# Altium project slyfoc_v2.PrjPcb
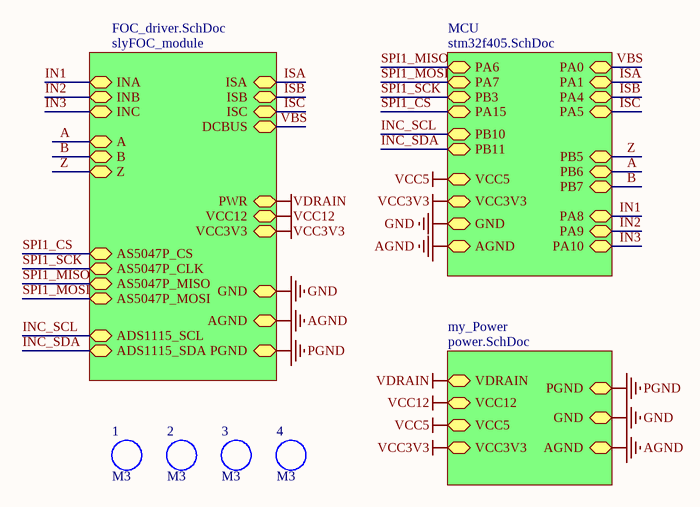
[diagram p0: control.SchDoc]
5 sheets, 141 parts. Net scope: hierarchical (ports join the sheet entries above them; power ports are global).
Board file: PCB.PcbDoc
Sheets:
  control.SchDoc
    my_Power = power.SchDoc
    MCU = stm32f405.SchDoc
    slyFOC_module = FOC_driver.SchDoc
      MOS_Half_Bridge_A = single_bridge.SchDoc
      MOS_Half_Bridge_B = single_bridge.SchDoc
      MOS_Half_Bridge_C = single_bridge.SchDoc

## Sheet control.SchDoc
size A4; SheetNumber: 1; SheetTotal: 5

### Parts
1  M3  [M3x9+6_N]
2  M3  [M3x9+6_N]
3  M3  [M3x9+6_N]
4  M3  [M3x9+6_N]

### Sub-sheets
MCU = stm32f405.SchDoc: PA1 (bidir), PA4 (bidir), PA5 (bidir), PA8 (bidir), PA9 (bidir), PA10 (bidir), PA0 (bidir), VCC3V3 (bidir), GND (bidir), AGND (bidir), PB5 (bidir), PB6 (bidir), PB7 (bidir), VCC5 (bidir), PA6 (bidir), PA7 (bidir), PB3 (bidir), PA15 (bidir), PB10 (bidir), PB11 (bidir)
my_Power = power.SchDoc: VCC12 (bidir), VDRAIN (bidir), VCC5 (bidir), VCC3V3 (bidir), GND (bidir), PGND (bidir), AGND (bidir)
slyFOC_module = FOC_driver.SchDoc: INA (bidir), INB (bidir), INC (bidir), ISA (bidir), ISB (bidir), ISC (bidir), PGND (bidir), AGND (bidir), GND (bidir), PWR (bidir), VCC12 (bidir), VCC3V3 (bidir), DCBUS (bidir), A (bidir), B (bidir), Z (bidir), AS5047P_CS (bidir), AS5047P_CLK (bidir), AS5047P_MISO (bidir), AS5047P_MOSI (bidir), ADS1115_SCL (bidir), ADS1115_SDA (bidir)

### Nets
AGND: sheet my_Power/AGND, sheet MCU/AGND, sheet slyFOC_module/AGND
GND: sheet my_Power/GND, sheet MCU/GND, sheet slyFOC_module/GND
PGND: sheet my_Power/PGND, sheet slyFOC_module/PGND
VCC3V3: sheet my_Power/VCC3V3, sheet MCU/VCC3V3, sheet slyFOC_module/VCC3V3
VCC5: sheet my_Power/VCC5, sheet MCU/VCC5
VCC12: sheet my_Power/VCC12, sheet slyFOC_module/VCC12
VDRAIN: sheet my_Power/VDRAIN, sheet slyFOC_module/PWR
A: sheet MCU/PB6, sheet slyFOC_module/A
B: sheet MCU/PB7, sheet slyFOC_module/B
IN1: sheet MCU/PA8, sheet slyFOC_module/INA
IN2: sheet MCU/PA9, sheet slyFOC_module/INB
IN3: sheet MCU/PA10, sheet slyFOC_module/INC
INC_SCL: sheet MCU/PB10, sheet slyFOC_module/ADS1115_SCL
INC_SDA: sheet MCU/PB11, sheet slyFOC_module/ADS1115_SDA
ISA: sheet MCU/PA1, sheet slyFOC_module/ISA
ISB: sheet MCU/PA4, sheet slyFOC_module/ISB
ISC: sheet MCU/PA5, sheet slyFOC_module/ISC
SPI1_CS: sheet MCU/PA15, sheet slyFOC_module/AS5047P_CS
SPI1_MISO: sheet MCU/PA6, sheet slyFOC_module/AS5047P_MISO
SPI1_MOSI: sheet MCU/PA7, sheet slyFOC_module/AS5047P_MOSI
SPI1_SCK: sheet MCU/PB3, sheet slyFOC_module/AS5047P_CLK
VBS: sheet MCU/PA0, sheet slyFOC_module/DCBUS
Z: sheet MCU/PB5, sheet slyFOC_module/Z

### Library data of the parts
1-4 = M3: 铜柱孔; BOM名称: 铜柱孔

## Sheet power.SchDoc
size A4; SheetNumber: 2; SheetTotal: 5
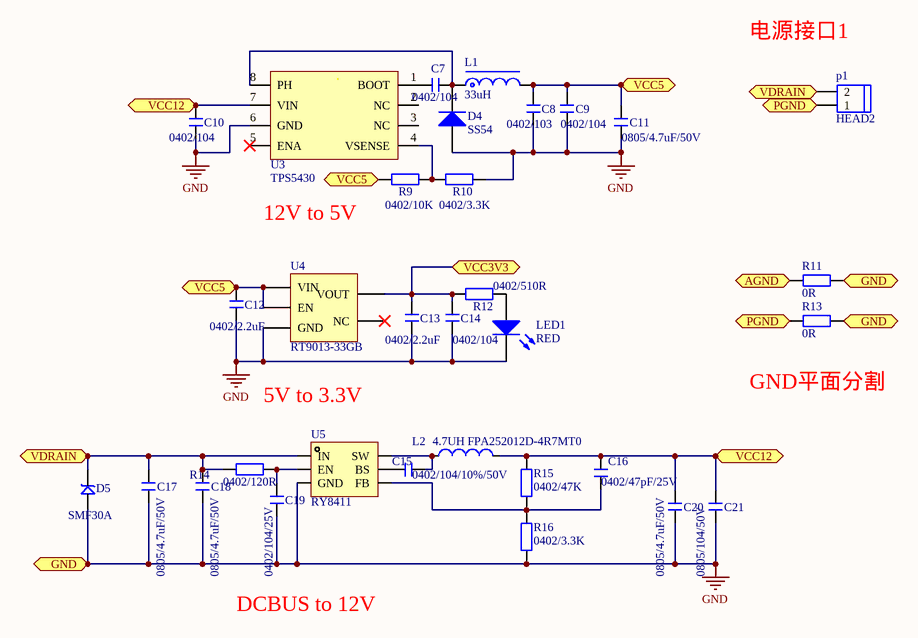
[diagram p1: power.SchDoc]

### Parts
C7  0402/104  [0402C]
C8  0402/103  [0402C]
C9  0402/104  [0402C]
C10  0402/104  [0402C]
C11  0805/4.7uF/50V  [0805C]
C12  0402/2.2uF  [0402C]
C13  0402/2.2uF  [0402C]
C14  0402/104  [0402C]
C15  0402/104/10%/50V  [0402C]
C16  0402/47pF/25V  [0402C]
C17  0805/4.7uF/50V  [0805C]
C18  0805/4.7uF/50V  [0805C]
C19  0402/104/25V  [0402C]
C20  0805/4.7uF/50V  [0805C]
C21  0805/104/50V  [0805C]
D4  SS54  [SMA]
D5  SMF30A  [SOD-123F]
L1  33uH  [CDRH73]
L2  4.7UH FPA252012D-4R7MT0  [NR2520]
LED1  RED  [LED 0603R]
p1  HEAD2  [KF301-5.0-2P]
R9  0402/10K  [0402R]
R10  0402/3.3K  [0402R]
R11  0R  [0603R]
R12  0402/510R  [0402R]
R13  0R  [0603R]
R14  0402/120R  [0402R]
R15  0402/47K  [0402R]
R16  0402/3.3K  [0402R]
U3  TPS5430  [SOIC-8-EP]
U4  RT9013-33GB  [SOT-23-5]
U5  RY8411  [SOT23-6]

### Ports
AGND (bidir), GND (bidir), PGND (bidir), VCC3V3 (bidir), VCC5 (bidir), VCC12 (bidir), VDRAIN (bidir)

### Nets
AGND: R11.1 ; port AGND
GND: C8.1 C9.1 C10.1 C11.1 C12.1 C13.1 C14.1 C17.1 C18.1 C19.1 C20.1 C21.1 D4.1(A) D5.2 LED1.2(K) R10.2 R11.2 R13.2 R16.1 U3.6(GND) U4.2(GND) U5.2(GND) ; port GND
PGND: p1.1 R13.1 ; port PGND
VCC3V3: C13.2 C14.2 R12.1 U4.5(VOUT) ; port VCC3V3
VCC5: C8.2 C9.2 C11.2 C12.2 L1.2 R9.1 U4.1(VIN) U4.3(EN) ; port VCC5
VCC12: C10.2 C16.2 C20.2 C21.2 L2.2 R15.2 U3.7(VIN) ; port VCC12
VDRAIN: C17.2 C18.2 D5.1 p1.2 R14.1 U5.5(IN) ; port VDRAIN
NetC7_1: C7.1 D4.2(K) L1.1 U3.8(PH)
NetC7_2: C7.2 U3.1(BOOT)
NetC15_1: C15.1 L2.1 U5.6(SW)
NetC15_2: C15.2 U5.1(BS)
NetC16_1: C16.1 R15.1 R16.2 U5.3(FB)
NetC19_2: C19.2 R14.2 U5.4(EN)
NetLED1_1: LED1.1(A) R12.2
NetR9_2: R9.2 R10.1 U3.4(VSENSE)

Not connected (* = marked no-connect by the designer): U3 2(NC) 3(NC) 5(ENA)* 9(pad); U4 4(NC)*

### Notes on the sheet
- 电源接口1
- 12V to 5V
- 5V to 3.3V
- (near R13) GND平面分割
- DCBUS to 12V

### Library data of the parts
C7 C9 C10 C14 = C: 贴片电容; value: 104; 嘉立创元件编号: C110251
C8 = C: 贴片电容; value: 103; 嘉立创元件编号: C15195
C11 C15-C21 = C: 贴片电容
  C11 C17 C18 C20: value: 4.7uF/50V; 嘉立创元件编号: C2991173
  C15: value: 104/10%/50V; 嘉立创元件编号: C110251
  C16: value: 47pF/25V; 嘉立创元件编号: C60137
  C19: value: 104/25V; 嘉立创元件编号: C110251
  C21: value: 104/50V; 嘉立创元件编号: C38141
C12 C13 = C: 贴片电容; value: 2.2uF; 嘉立创元件编号: C12530
D4 = SS54(DO-214AC ): 续流二极管; 嘉立创元件编号: C7420369
D5 = SMF30A: TVS二极管 静电和浪涌保护 30V; 嘉立创元件编号: C19077518
L1 = L-CDRH: 功率屏蔽电感; BOM名称: 功率屏蔽电感; 嘉立创元件编号: C5339524
L2 = L: 小功率贴片电感; 嘉立创元件编号: C5289265
LED1 = LED: RED 蓝、红; 嘉立创元件编号: C125100
p1 = HEAD2: 接线端子2P; 嘉立创元件编号: C474881
R9 = R: 贴片电阻; value: 10K; 嘉立创元件编号: C25744
R10 R16 = R: 贴片电阻; value: 3.3K; 嘉立创元件编号: C25890
R11 R13 = R: 贴片电阻 0603; BOM名称: 贴片电阻; 嘉立创元件编号: C2906974
R12 = R: 贴片电阻; value: 510R; 嘉立创元件编号: C25123
R14 = R: 贴片电阻; value: 120R; 嘉立创元件编号: C2909315
R15 = R: 贴片电阻; value: 47K; 嘉立创元件编号: C25792
U3 = TPS5430: DCDC开关电源芯片; 嘉立创元件编号: C9864
U4 = RT9013-33GB: LDO 5V TO 3.3V; 嘉立创元件编号: C47773
U5 = RY8411: DCDC降压芯片 42V输入 1.2A; 嘉立创元件编号: C2935411

## Sheet stm32f405.SchDoc
size A4; SheetNumber: 3; SheetTotal: 5
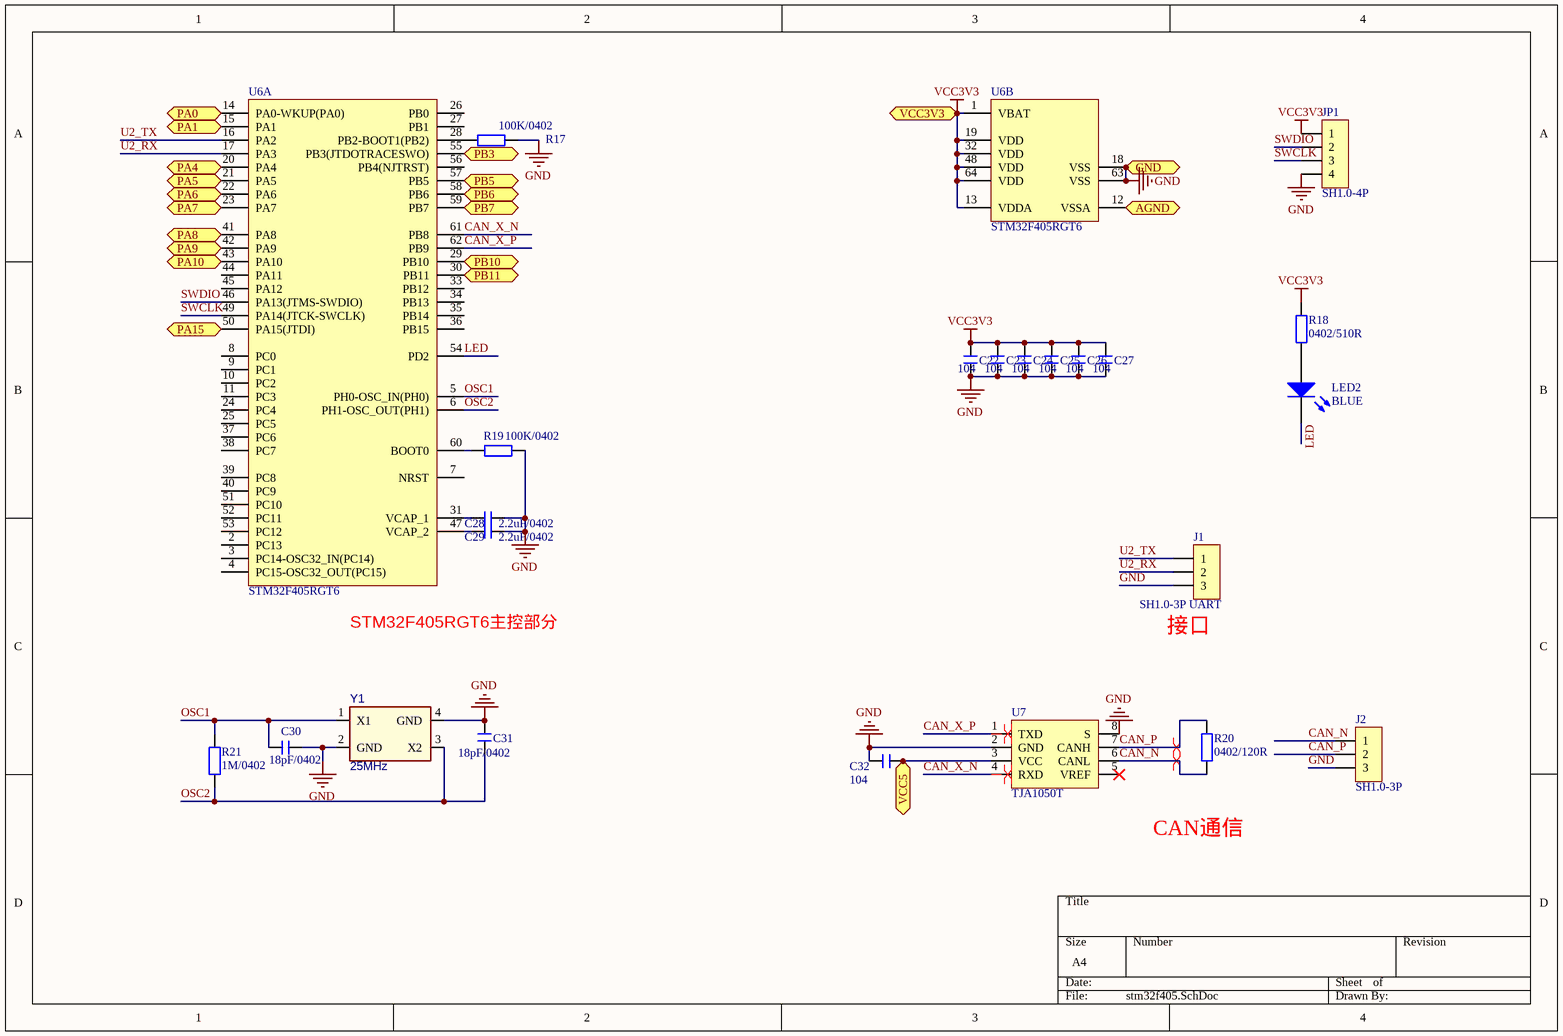
[diagram p2: stm32f405.SchDoc]

### Parts
C22  104  [0402C]
C23  104  [0402C]
C24  104  [0402C]
C25  104  [0402C]
C26  104  [0402C]
C27  104  [0402C]
C28  2.2uF/0402  [0402C]
C29  2.2uF/0402  [0402C]
C30  18pF/0402  [0402C]
C31  18pF/0402  [0402C]
C32  104  [0402C]
J1  SH1.0-3P UART  [SH1.0_3P-P1.00-H3.00]
J2  SH1.0-3P  [SH1.0_3P-P1.00-H3.00]
JP1  SH1.0-4P  [SH1.0-P1.00_-4P]
LED2  BLUE  [LED 0603B]
R17  100K/0402  [0402R]
R18  0402/510R  [0402R]
R19  100K/0402  [0402R]
R20  0402/120R  [0402R]
R21  1M/0402  [0402R]
U6  STM32F405RGT6  [LQFP-64_L10.0-W10.0-P0.50-LS12.0-BL]  (parts A,B of 2)
U7  TJA1050T  [SOP8]
Y1  25MHz  [CRY4_3225]

### Ports
AGND (bidir), GND (bidir), PA0 (bidir), PA1 (bidir), PA4 (bidir), PA5 (bidir), PA6 (bidir), PA7 (bidir), PA8 (bidir), PA9 (bidir), PA10 (bidir), PA15 (bidir), PB3 (bidir), PB5 (bidir), PB6 (bidir), PB7 (bidir), PB10 (bidir), PB11 (bidir), VCC3V3 (bidir), VCC5 (bidir)

### Nets
AGND: U6.12(VSSA) ; port AGND
GND: C22.2 C23.2 C24.2 C25.2 C26.2 C27.2 C28.1 C29.1 C30.1 C31.2 C32.1 J1.3 J2.3 JP1.4 R17.2 R19.2 U6.18(VSS) U6.63(VSS) U7.2(GND) U7.8(S) Y1.2(GND) Y1.4(GND) ; port GND
VCC3V3: C22.1 C23.1 C24.1 C25.1 C26.1 C27.1 JP1.1 R18.1 U6.1(VBAT) U6.13(VDDA) U6.19(VDD) U6.32(VDD) U6.48(VDD) U6.64(VDD) ; port VCC3V3
VCC5: C32.2 U7.3(VCC) ; port VCC5
A: U6.58(PB6) ; port PB6
B: U6.59(PB7) ; port PB7
CAN_N: J2.1 R20.2 U7.6(CANL)
CAN_P: J2.2 R20.1 U7.7(CANH)
CAN_X_N: U6.61(PB8) U7.4(RXD)
CAN_X_P: U6.62(PB9) U7.1(TXD)
IN1: U6.41(PA8) ; port PA8
IN2: U6.42(PA9) ; port PA9
IN3: U6.43(PA10) ; port PA10
INC_SCL: U6.29(PB10) ; port PB10
INC_SDA: U6.30(PB11) ; port PB11
ISA: U6.15(PA1) ; port PA1
ISB: U6.20(PA4) ; port PA4
ISC: U6.21(PA5) ; port PA5
LED: LED2.2(K) U6.54(PD2)
OSC1: C30.2 R21.2 U6.5(PH0-OSC_IN(PH0)) Y1.1(X1)
OSC2: C31.1 R21.1 U6.6(PH1-OSC_OUT(PH1)) Y1.3(X2)
SPI1_CS: U6.50(PA15(JTDI)) ; port PA15
SPI1_MISO: U6.22(PA6) ; port PA6
SPI1_MOSI: U6.23(PA7) ; port PA7
SPI1_SCK: U6.55(PB3(JTDOTRACESWO)) ; port PB3
SWCLK: JP1.3 U6.49(PA14(JTCK-SWCLK))
SWDIO: JP1.2 U6.46(PA13(JTMS-SWDIO))
U2_RX: J1.2 U6.17(PA3)
U2_TX: J1.1 U6.16(PA2)
VBS: U6.14(PA0-WKUP(PA0)) ; port PA0
Z: U6.57(PB5) ; port PB5
NetC28_2: C28.2 U6.31(VCAP_1)
NetC29_2: C29.2 U6.47(VCAP_2)
NetLED2_1: LED2.1(A) R18.2
NetR17_1: R17.1 U6.28(PB2-BOOT1(PB2))
NetR19_1: R19.1 U6.60(BOOT0)

Not connected (* = marked no-connect by the designer): U6 2(PC13) 3(PC14-OSC32_IN(PC14)) 4(PC15-OSC32_OUT(PC15)) 7(NRST) 8(PC0) 9(PC1) 10(PC2) 11(PC3) 24(PC4) 25(PC5) 26(PB0) 27(PB1) 33(PB12) 34(PB13) 35(PB14) 36(PB15) 37(PC6) 38(PC7) 39(PC8) 40(PC9) 44(PA11) 45(PA12) 51(PC10) 52(PC11) 53(PC12) 56(PB4(NJTRST)); U7 5(VREF)*

### Layout directives
differential pair: CAN_N, CAN_P, CAN_X_N, CAN_X_P

### Notes on the sheet
- (near U6) STM32F405RGT6主控部分
- (near J1) 接口
- CAN通信

### Library data of the parts
C22-C32 = C: 贴片电容; BOM名称: 无极性贴片电容
  C22-C27 C32: 嘉立创元件编号: C110251
  C28 C29: 嘉立创元件编号: C12530
  C30 C31: 嘉立创元件编号: C5137554
J1 J2 = 3p_G: 3针排针; 嘉立创元件编号: C7430445
JP1 = 4p_G: 4针排针; BOM名称: 4P接插件; 嘉立创元件编号: C7430446
LED2 = LED: RED 蓝、红; 嘉立创元件编号: C84267
R17 R19 R21 = R: 贴片电阻; BOM名称: 贴片电阻
  R17 R19: 嘉立创元件编号: C25741
  R21: 嘉立创元件编号: C26083
R18 = R: 贴片电阻; value: 510R; 嘉立创元件编号: C25123
R20 = R: 贴片电阻; value: 120R; 嘉立创元件编号: C2909315
U7 = TJA1050T: CAN通信芯片; 嘉立创元件编号: C21714366
Y1 = CRYSTAL_4P: 4脚晶振; 嘉立创元件编号: C70593
U6 = STM32F405RGT6: 嘉立创元件编号: C15742

## Sheet FOC_driver.SchDoc
size A4; SheetNumber: 4; SheetTotal: 5
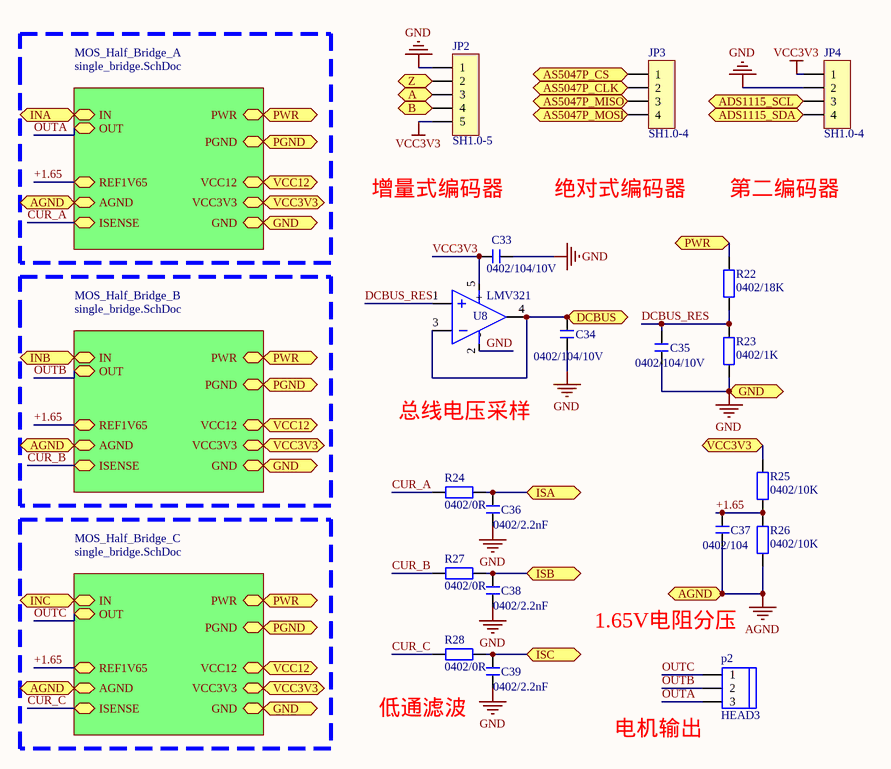
[diagram p3: FOC_driver.SchDoc]

### Parts
C33  0402/104/10V  [0402C]
C34  0402/104/10V  [0402C]
C35  0402/104/10V  [0402C]
C36  0402/2.2nF  [0402C]
C37  0402/104  [0402C]
C38  0402/2.2nF  [0402C]
C39  0402/2.2nF  [0402C]
JP2  SH1.0-5  [SH1.0-5P-P1.00]
JP3  SH1.0-4  [SH1.0-P1.00_-4P]
JP4  SH1.0-4  [SH1.0-P1.00_-4P]
p2  HEAD3  [KF301-5.0-3P]
R22  0402/18K  [0402R]
R23  0402/1K  [0402R]
R24  0402/0R  [0402R]
R25  0402/10K  [0402R]
R26  0402/10K  [0402R]
R27  0402/0R  [0402R]
R28  0402/0R  [0402R]
U8  LMV321  [SOT-23-5]

### Sub-sheets
MOS_Half_Bridge_A = single_bridge.SchDoc: IN (bidir), PWR (bidir), GND (bidir), ISENSE (bidir), VCC3V3 (bidir), PGND (bidir), VCC12 (bidir), REF1V65 (bidir), AGND (bidir), OUT (bidir)
MOS_Half_Bridge_B = single_bridge.SchDoc: IN (bidir), PWR (bidir), GND (bidir), ISENSE (bidir), VCC3V3 (bidir), PGND (bidir), VCC12 (bidir), REF1V65 (bidir), AGND (bidir), OUT (bidir)
MOS_Half_Bridge_C = single_bridge.SchDoc: IN (bidir), PWR (bidir), GND (bidir), ISENSE (bidir), VCC3V3 (bidir), PGND (bidir), VCC12 (bidir), REF1V65 (bidir), AGND (bidir), OUT (bidir)

### Ports
A (bidir), ADS1115_SCL (bidir), ADS1115_SDA (bidir), AGND (bidir), AS5047P_CLK (bidir), AS5047P_CS (bidir), AS5047P_MISO (bidir), AS5047P_MOSI (bidir), B (bidir), DCBUS (bidir), GND (bidir), INA (bidir), INB (bidir), INC (bidir), ISA (bidir), ISB (bidir), ISC (bidir), PGND (bidir), PWR (bidir), VCC3V3 (bidir), VCC12 (bidir), Z (bidir)

### Nets
AGND: C37.2 R26.2 ; port AGND, sheet MOS_Half_Bridge_A/AGND, sheet MOS_Half_Bridge_B/AGND, sheet MOS_Half_Bridge_C/AGND
GND: C33.1 C34.2 C35.1 C36.1 C38.1 C39.1 JP2.1 JP4.2 R23.1 U8.2(-) ; port GND, sheet MOS_Half_Bridge_A/GND, sheet MOS_Half_Bridge_B/GND, sheet MOS_Half_Bridge_C/GND
PGND: port PGND, sheet MOS_Half_Bridge_A/PGND, sheet MOS_Half_Bridge_B/PGND, sheet MOS_Half_Bridge_C/PGND
VCC3V3: C33.2 JP2.5 JP4.1 R25.1 U8.5(+) ; port VCC3V3, sheet MOS_Half_Bridge_A/VCC3V3, sheet MOS_Half_Bridge_B/VCC3V3, sheet MOS_Half_Bridge_C/VCC3V3
VCC12: port VCC12, sheet MOS_Half_Bridge_A/VCC12, sheet MOS_Half_Bridge_B/VCC12, sheet MOS_Half_Bridge_C/VCC12
VDRAIN: R22.2 ; port PWR, sheet MOS_Half_Bridge_A/PWR, sheet MOS_Half_Bridge_B/PWR, sheet MOS_Half_Bridge_C/PWR
+1.65: C37.1 R25.2 R26.1 ; sheet MOS_Half_Bridge_A/REF1V65, sheet MOS_Half_Bridge_B/REF1V65, sheet MOS_Half_Bridge_C/REF1V65
A: JP2.3 ; port A
B: JP2.4 ; port B
CUR_A: R24.2 ; sheet MOS_Half_Bridge_A/ISENSE
CUR_B: R27.2 ; sheet MOS_Half_Bridge_B/ISENSE
CUR_C: R28.2 ; sheet MOS_Half_Bridge_C/ISENSE
DCBUS_RES: C35.2 R22.1 R23.2 U8.1(IN+)
IN1: port INA, sheet MOS_Half_Bridge_A/IN
IN2: port INB, sheet MOS_Half_Bridge_B/IN
IN3: port INC, sheet MOS_Half_Bridge_C/IN
INC_SCL: JP4.3 ; port ADS1115_SCL
INC_SDA: JP4.4 ; port ADS1115_SDA
ISA: C36.2 R24.1 ; port ISA
ISB: C38.2 R27.1 ; port ISB
ISC: C39.2 R28.1 ; port ISC
OUTA: p2.3 ; sheet MOS_Half_Bridge_A/OUT  [project net OUT]
OUTB: p2.2 ; sheet MOS_Half_Bridge_B/OUT  [project net OUT]
OUTC: p2.1 ; sheet MOS_Half_Bridge_C/OUT  [project net OUT]
SPI1_CS: JP3.1 ; port AS5047P_CS
SPI1_MISO: JP3.3 ; port AS5047P_MISO
SPI1_MOSI: JP3.4 ; port AS5047P_MOSI
SPI1_SCK: JP3.2 ; port AS5047P_CLK
VBS: C34.1 U8.3(IN-) U8.4(OUT) ; port DCBUS
Z: JP2.2 ; port Z

### Notes on the sheet
- 增量式编码器
- 绝对式编码器
- 第二编码器
- 总线电压采样
- (near p2) 1.65V电阻分压
- 低通滤波
- 电机输出

### Library data of the parts
C33-C35 = C: 贴片电容; value: 104/10V; 嘉立创元件编号: C110251
C36 C38 C39 = C: 贴片电容; value: 2.2nF; 嘉立创元件编号: C2987940
C37 = C: 贴片电容; value: 104; 嘉立创元件编号: C110251
JP2 = 5p_G: 5针排针; BOM名称: 4P接插件; 版权归属: 源创客; 学习资源: www.ooocke.com; 嘉立创元件编号: C3029344
JP3 JP4 = 4p_G: 4针排针; BOM名称: 4P接插件; 版权归属: 源创客; 学习资源: www.ooocke.com; 嘉立创元件编号: C7430446
p2 = HEAD3: 接线端子3P; 嘉立创元件编号: C474882
R22 = R: 贴片电阻; value: 18K; 嘉立创元件编号: C138044
R23 = R: 贴片电阻; value: 1K; 嘉立创元件编号: C11702
R24 R27 R28 = R: 贴片电阻; value: 0R; 嘉立创元件编号: C17168
R25 R26 = R: 贴片电阻; value: 10K; 嘉立创元件编号: C25744
U8 = LMV321: 运放; 嘉立创元件编号: C7972

## Sheet single_bridge.SchDoc
size A4; SheetNumber: 5; SheetTotal: 5
Used 3 times, as channels slyFOC_module/MOS_Half_Bridge_A, slyFOC_module/MOS_Half_Bridge_B, slyFOC_module/MOS_Half_Bridge_C. Parts and nets are listed once, with the designators drawn on the sheet.
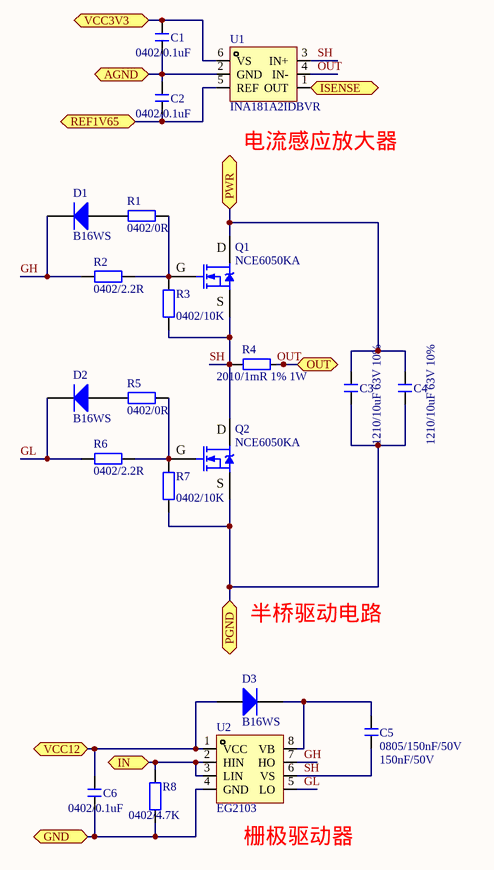
[diagram p4: single_bridge.SchDoc]

### Parts
C1  0402/0.1uF  [0402C]
C2  0402/0.1uF  [0402C]
C3  1210/10uF 63V 10%  [1210C]
C4  1210/10uF 63V 10%  [1210C]
C5  0805/150nF/50V  value 150nF/50V  [0805C]
C6  0402/0.1uF  [0402C]
D1  B16WS  [SOD-323]
D2  B16WS  [SOD-323]
D3  B16WS  [SOD-323]
Q1  NCE6050KA  [TO252]
Q2  NCE6050KA  [TO252]
R1  0402/0R  [0402R]
R2  0402/2.2R  [0402R]
R3  0402/10K  [0402R]
R4  2010/1mR 1% 1W  [2010R]
R5  0402/0R  [0402R]
R6  0402/2.2R  [0402R]
R7  0402/10K  [0402R]
R8  0402/4.7K  [0402R]
U1  INA181A2IDBVR  [SOT23-6]
U2  EG2103  [SOP8 - short]

### Ports
AGND (bidir), GND (bidir), IN (bidir), ISENSE (bidir), OUT (bidir), PGND (bidir), PWR (bidir), REF1V65 (bidir), VCC3V3 (bidir), VCC12 (bidir)

### Nets
AGND: C1.1 C2.2 U1.2(GND) ; port AGND
GH: D1.2(K) R2.1 U2.7(HO)
GL: D2.2(K) R6.1 U2.5(LO)
GND: C6.1 R8.1 U2.4(GND) ; port GND
IN: R8.2 U2.2(HIN) U2.3(LIN) ; port IN
ISENSE: U1.1(OUT) ; port ISENSE
OUT: R4.1 U1.4(IN-) ; port OUT
PGND: C3.1 C4.1 Q2.3(S) R7.1 ; port PGND
PWR: C3.2 C4.2 Q1.2(D) ; port PWR
REF1V65: C2.1 U1.5(REF) ; port REF1V65
SH: C5.2 Q1.3(S) Q2.2(D) R3.1 R4.2 U1.3(IN+) U2.6(VS)
VCC3V3: C1.2 U1.6(VS) ; port VCC3V3
VCC12: C6.2 D3.1(A) U2.1(VCC) ; port VCC12
NetC5_1: C5.1 D3.2(K) U2.8(VB)
NetD1_1: D1.1(A) R1.1
NetD2_1: D2.1(A) R5.1
NetQ1_1: Q1.1(G) R1.2 R2.2 R3.2
NetQ2_1: Q2.1(G) R5.2 R6.2 R7.2

### Channels
slyFOC_module/MOS_Half_Bridge_A: designators end in _MOS_Half_Bridge_A; ports AGND=AGND GND=GND IN=IN1 ISENSE=CUR_A OUT=OUT PGND=PGND PWR=VDRAIN REF1V65=+1.65 VCC3V3=VCC3V3 VCC12=VCC12
slyFOC_module/MOS_Half_Bridge_B: designators end in _MOS_Half_Bridge_B; ports AGND=AGND GND=GND IN=IN2 ISENSE=CUR_B OUT=OUT PGND=PGND PWR=VDRAIN REF1V65=+1.65 VCC3V3=VCC3V3 VCC12=VCC12
slyFOC_module/MOS_Half_Bridge_C: designators end in _MOS_Half_Bridge_C; ports AGND=AGND GND=GND IN=IN3 ISENSE=CUR_C OUT=OUT PGND=PGND PWR=VDRAIN REF1V65=+1.65 VCC3V3=VCC3V3 VCC12=VCC12

### Notes on the sheet
- (near U1) 电流感应放大器
- 半桥驱动电路
- (near U2) 栅极驱动器

### Library data of the parts
C1 C2 C6 = C: 贴片电容; value: 0.1uF; 嘉立创元件编号: C110251
C3-C5 = C: 贴片电容
  C3 C4: value: 10uF 63V 10%; 嘉立创元件编号: C437568
  C5: 嘉立创元件编号: C376934
D1-D3 = B16WS: 肖特基二极管 60V 1A; 嘉立创元件编号: C7420327
Q1 Q2 = NCE6050KA: N沟场效应管60V50A; BOM名称: N沟场效应管; 嘉立创元件编号: C96013
R1 R5 = R: 贴片电阻; value: 0R; 嘉立创元件编号: C17168
R2 R6 = R: 贴片电阻; value: 2.2R; 嘉立创元件编号: C25101
R3 R7 = R: 贴片电阻; value: 10K; 嘉立创元件编号: C25744
R4 = R: 贴片电阻; value: 1mR 1% 1W; 嘉立创元件编号: C2094559
R8 = R: 贴片电阻; value: 4.7K; 嘉立创元件编号: C25900
U1 = INA181A2IDBVR: 单路，高共模电压，50V/V电流放大器; 嘉立创元件编号: C2058784
U2 = EG2103: 大功率栅极驱动器; 嘉立创元件编号: C480654

## Nets that join several sheets
AGND: power (R11.1), stm32f405 (U6.12), FOC_driver (C37.2 R26.2), slyFOC_module/MOS_Half_Bridge_A (C1_MOS_Half_Bridge_A.1 C2_MOS_Half_Bridge_A.2 U1_MOS_Half_Bridge_A.2), slyFOC_module/MOS_Half_Bridge_B (C1_MOS_Half_Bridge_B.1 C2_MOS_Half_Bridge_B.2 U1_MOS_Half_Bridge_B.2), slyFOC_module/MOS_Half_Bridge_C (C1_MOS_Half_Bridge_C.1 C2_MOS_Half_Bridge_C.2 U1_MOS_Half_Bridge_C.2)
GND: power (22 pins), stm32f405 (22 pins), FOC_driver (10 pins), slyFOC_module/MOS_Half_Bridge_A (C6_MOS_Half_Bridge_A.1 R8_MOS_Half_Bridge_A.1 U2_MOS_Half_Bridge_A.4), slyFOC_module/MOS_Half_Bridge_B (C6_MOS_Half_Bridge_B.1 R8_MOS_Half_Bridge_B.1 U2_MOS_Half_Bridge_B.4), slyFOC_module/MOS_Half_Bridge_C (C6_MOS_Half_Bridge_C.1 R8_MOS_Half_Bridge_C.1 U2_MOS_Half_Bridge_C.4)
PGND: power (p1.1 R13.1), slyFOC_module/MOS_Half_Bridge_A (C3_MOS_Half_Bridge_A.1 C4_MOS_Half_Bridge_A.1 Q2_MOS_Half_Bridge_A.3 R7_MOS_Half_Bridge_A.1), slyFOC_module/MOS_Half_Bridge_B (C3_MOS_Half_Bridge_B.1 C4_MOS_Half_Bridge_B.1 Q2_MOS_Half_Bridge_B.3 R7_MOS_Half_Bridge_B.1), slyFOC_module/MOS_Half_Bridge_C (C3_MOS_Half_Bridge_C.1 C4_MOS_Half_Bridge_C.1 Q2_MOS_Half_Bridge_C.3 R7_MOS_Half_Bridge_C.1)
VCC3V3: power (C13.2 C14.2 R12.1 U4.5), stm32f405 (14 pins), FOC_driver (5 pins), slyFOC_module/MOS_Half_Bridge_A (C1_MOS_Half_Bridge_A.2 U1_MOS_Half_Bridge_A.6), slyFOC_module/MOS_Half_Bridge_B (C1_MOS_Half_Bridge_B.2 U1_MOS_Half_Bridge_B.6), slyFOC_module/MOS_Half_Bridge_C (C1_MOS_Half_Bridge_C.2 U1_MOS_Half_Bridge_C.6)
VCC5: power (8 pins), stm32f405 (C32.2 U7.3)
VCC12: power (7 pins), slyFOC_module/MOS_Half_Bridge_A (C6_MOS_Half_Bridge_A.2 D3_MOS_Half_Bridge_A.1 U2_MOS_Half_Bridge_A.1), slyFOC_module/MOS_Half_Bridge_B (C6_MOS_Half_Bridge_B.2 D3_MOS_Half_Bridge_B.1 U2_MOS_Half_Bridge_B.1), slyFOC_module/MOS_Half_Bridge_C (C6_MOS_Half_Bridge_C.2 D3_MOS_Half_Bridge_C.1 U2_MOS_Half_Bridge_C.1)
VDRAIN: power (6 pins), FOC_driver (R22.2), slyFOC_module/MOS_Half_Bridge_A (C3_MOS_Half_Bridge_A.2 C4_MOS_Half_Bridge_A.2 Q1_MOS_Half_Bridge_A.2), slyFOC_module/MOS_Half_Bridge_B (C3_MOS_Half_Bridge_B.2 C4_MOS_Half_Bridge_B.2 Q1_MOS_Half_Bridge_B.2), slyFOC_module/MOS_Half_Bridge_C (C3_MOS_Half_Bridge_C.2 C4_MOS_Half_Bridge_C.2 Q1_MOS_Half_Bridge_C.2)
+1.65: FOC_driver (C37.1 R25.2 R26.1), slyFOC_module/MOS_Half_Bridge_A (C2_MOS_Half_Bridge_A.1 U1_MOS_Half_Bridge_A.5), slyFOC_module/MOS_Half_Bridge_B (C2_MOS_Half_Bridge_B.1 U1_MOS_Half_Bridge_B.5), slyFOC_module/MOS_Half_Bridge_C (C2_MOS_Half_Bridge_C.1 U1_MOS_Half_Bridge_C.5)
A: stm32f405 (U6.58), FOC_driver (JP2.3)
B: stm32f405 (U6.59), FOC_driver (JP2.4)
CUR_A: FOC_driver (R24.2), slyFOC_module/MOS_Half_Bridge_A (U1_MOS_Half_Bridge_A.1)
CUR_B: FOC_driver (R27.2), slyFOC_module/MOS_Half_Bridge_B (U1_MOS_Half_Bridge_B.1)
CUR_C: FOC_driver (R28.2), slyFOC_module/MOS_Half_Bridge_C (U1_MOS_Half_Bridge_C.1)
IN1: stm32f405 (U6.41), slyFOC_module/MOS_Half_Bridge_A (R8_MOS_Half_Bridge_A.2 U2_MOS_Half_Bridge_A.2 U2_MOS_Half_Bridge_A.3)
IN2: stm32f405 (U6.42), slyFOC_module/MOS_Half_Bridge_B (R8_MOS_Half_Bridge_B.2 U2_MOS_Half_Bridge_B.2 U2_MOS_Half_Bridge_B.3)
IN3: stm32f405 (U6.43), slyFOC_module/MOS_Half_Bridge_C (R8_MOS_Half_Bridge_C.2 U2_MOS_Half_Bridge_C.2 U2_MOS_Half_Bridge_C.3)
INC_SCL: stm32f405 (U6.29), FOC_driver (JP4.3)
INC_SDA: stm32f405 (U6.30), FOC_driver (JP4.4)
ISA: stm32f405 (U6.15), FOC_driver (C36.2 R24.1)
ISB: stm32f405 (U6.20), FOC_driver (C38.2 R27.1)
ISC: stm32f405 (U6.21), FOC_driver (C39.2 R28.1)
OUT: FOC_driver (p2.1), slyFOC_module/MOS_Half_Bridge_C (R4_MOS_Half_Bridge_C.1 U1_MOS_Half_Bridge_C.4)
OUT: FOC_driver (p2.2), slyFOC_module/MOS_Half_Bridge_B (R4_MOS_Half_Bridge_B.1 U1_MOS_Half_Bridge_B.4)
OUT: FOC_driver (p2.3), slyFOC_module/MOS_Half_Bridge_A (R4_MOS_Half_Bridge_A.1 U1_MOS_Half_Bridge_A.4)
SPI1_CS: stm32f405 (U6.50), FOC_driver (JP3.1)
SPI1_MISO: stm32f405 (U6.22), FOC_driver (JP3.3)
SPI1_MOSI: stm32f405 (U6.23), FOC_driver (JP3.4)
SPI1_SCK: stm32f405 (U6.55), FOC_driver (JP3.2)
VBS: stm32f405 (U6.14), FOC_driver (C34.1 U8.3 U8.4)
Z: stm32f405 (U6.57), FOC_driver (JP2.2)